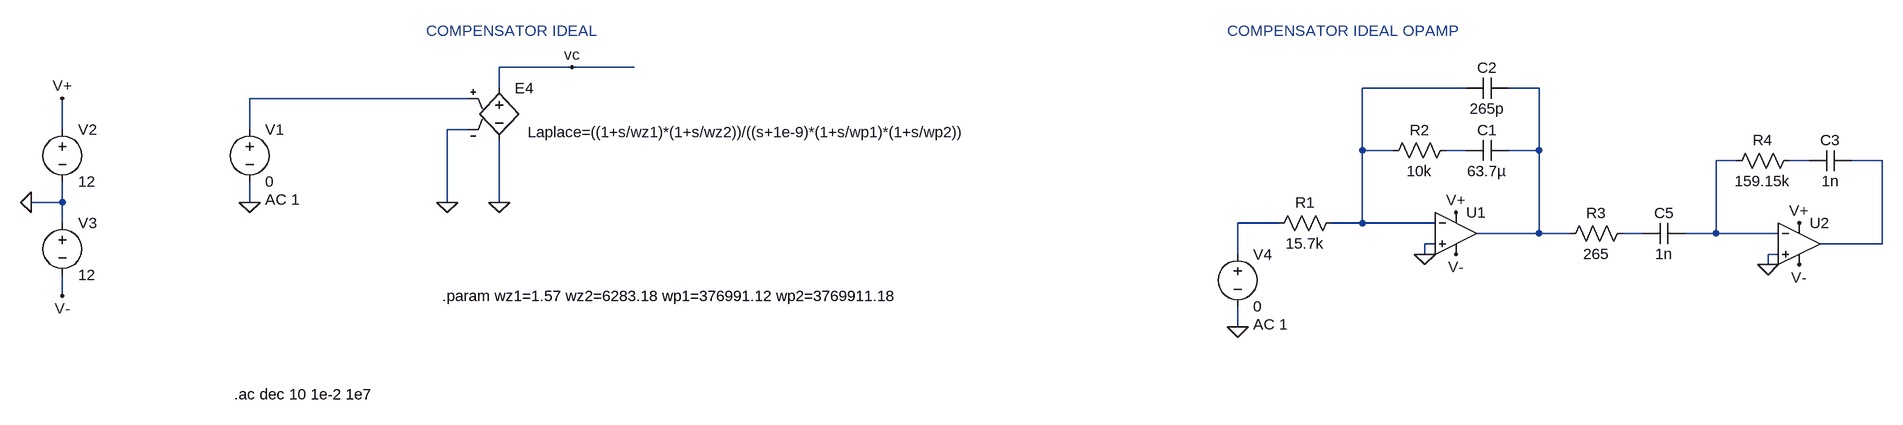
[diagram p0: schematic CompensatorFDT.asc]
CompensatorFDT.asc, the LTspice schematic file:
Version 4.1
SHEET 1 4068 680
WIRE 912 128 800 128
WIRE 1008 128 912 128
WIRE 800 160 800 128
WIRE 2288 160 2128 160
WIRE 2400 160 2352 160
WIRE 752 176 416 176
WIRE 128 224 128 176
WIRE 416 224 416 176
WIRE 752 224 720 224
WIRE 2128 256 2128 160
WIRE 2176 256 2128 256
WIRE 2288 256 2256 256
WIRE 2400 256 2400 160
WIRE 2400 256 2352 256
WIRE 2704 272 2672 272
WIRE 2816 272 2784 272
WIRE 2928 272 2880 272
WIRE 128 336 128 304
WIRE 128 336 80 336
WIRE 416 336 416 304
WIRE 720 336 720 224
WIRE 800 336 800 240
WIRE 128 368 128 336
WIRE 2000 368 1936 368
WIRE 2128 368 2128 256
WIRE 2128 368 2080 368
WIRE 2240 368 2128 368
WIRE 2400 384 2400 256
WIRE 2400 384 2304 384
WIRE 2448 384 2400 384
WIRE 2560 384 2528 384
WIRE 2672 384 2672 272
WIRE 2672 384 2624 384
WIRE 2768 384 2672 384
WIRE 2240 400 2224 400
WIRE 2928 400 2928 272
WIRE 2928 400 2832 400
WIRE 1936 416 1936 368
WIRE 2224 416 2224 400
WIRE 2768 416 2752 416
WIRE 2752 432 2752 416
WIRE 128 480 128 448
WIRE 1936 528 1936 496
FLAG 912 128 vc
FLAG 800 336 0
FLAG 720 336 0
FLAG 416 336 0
FLAG 80 336 0
FLAG 128 176 V+
FLAG 128 480 V-
FLAG 2224 416 0
FLAG 2752 432 0
FLAG 2272 352 V+
FLAG 2272 416 V-
FLAG 2800 368 V+
FLAG 2800 432 V-
FLAG 1936 528 0
SYMBOL e 800 144 R0
WINDOW 3 44 84 Left 2
SYMATTR Value Laplace=((1+s/wz1)*(1+s/wz2))/((s+1e-9)*(1+s/wp1)*(1+s/wp2))
SYMATTR InstName E4
SYMBOL voltage 416 208 R0
WINDOW 123 24 124 Left 2
WINDOW 39 0 0 Left 0
SYMATTR Value2 AC 1
SYMATTR InstName V1
SYMATTR Value 0
SYMBOL voltage 128 208 R0
SYMATTR InstName V2
SYMATTR Value 12
SYMBOL voltage 128 352 R0
SYMATTR InstName V3
SYMATTR Value 12
SYMBOL OpAmps\\UniversalOpAmp 2272 384 R0
SYMATTR InstName U1
SYMBOL res 2272 240 R90
WINDOW 0 0 56 VBottom 2
WINDOW 3 32 56 VTop 2
SYMATTR InstName R2
SYMATTR Value 10k
SYMBOL cap 2352 240 R90
WINDOW 0 0 32 VBottom 2
WINDOW 3 32 32 VTop 2
SYMATTR InstName C1
SYMATTR Value 63.7µ
SYMBOL cap 2352 144 R90
WINDOW 0 0 32 VBottom 2
WINDOW 3 32 32 VTop 2
SYMATTR InstName C2
SYMATTR Value 265p
SYMBOL OpAmps\\UniversalOpAmp 2800 400 R0
SYMATTR InstName U2
SYMBOL res 2544 368 R90
WINDOW 0 0 56 VBottom 2
WINDOW 3 32 56 VTop 2
SYMATTR InstName R3
SYMATTR Value 265
SYMBOL res 2800 256 R90
WINDOW 0 0 56 VBottom 2
WINDOW 3 32 56 VTop 2
SYMATTR InstName R4
SYMATTR Value 159.15k
SYMBOL cap 2880 256 R90
WINDOW 0 0 32 VBottom 2
WINDOW 3 32 32 VTop 2
SYMATTR InstName C3
SYMATTR Value 1n
SYMBOL cap 2624 368 R90
WINDOW 0 0 32 VBottom 2
WINDOW 3 32 32 VTop 2
SYMATTR InstName C5
SYMATTR Value 1n
SYMBOL res 2096 352 R90
WINDOW 0 0 56 VBottom 2
WINDOW 3 32 56 VTop 2
SYMATTR InstName R1
SYMATTR Value 15.7k
SYMBOL voltage 1936 400 R0
WINDOW 123 24 124 Left 2
WINDOW 39 0 0 Left 0
SYMATTR Value2 AC 1
SYMATTR InstName V4
SYMATTR Value 0
TEXT 712 480 Left 2 !.param wz1=1.57 wz2=6283.18 wp1=376991.12 wp2=3769911.18
TEXT 688 72 Left 2 ;COMPENSATOR IDEAL
TEXT 392 632 Left 2 !.ac dec 10 1e-2 1e7
TEXT 1920 72 Left 2 ;COMPENSATOR IDEAL OPAMP

The netlist it stands for:
* CompensatorFDT.asc
E4 vc 0 N003 0 Laplace=((1+s/wz1)*(1+s/wz2))/((s+1e-9)*(1+s/wp1)*(1+s/wp2))
V1 N003 0 0 AC 1
V2 V+ 0 12
V3 0 V- 12
X§U1 0 N001 V+ V- N002 level1 Avol=1Meg GBW=10Meg Vos=0 En=0 Enk=0 In=0 Ink=0 Rin=500Meg  ; pins In+ In- V+ V- OUT
R2 N004 N001 10k
C1 N002 N004 63.7µ
C2 N002 N001 265p
X§U2 0 N005 V+ V- N007 level1 Avol=1Meg GBW=10Meg Vos=0 En=0 Enk=0 In=0 Ink=0 Rin=500Meg  ; pins In+ In- V+ V- OUT
R3 N009 N002 265
R4 N006 N005 159.15k
C3 N007 N006 1n
C5 N005 N009 1n
R1 N001 N008 15.7k
V4 N008 0 0 AC 1
.param wz1=1.57 wz2=6283.18 wp1=376991.12 wp2=3769911.18
* COMPENSATOR IDEAL
.ac dec 10 1e-2 1e7
* COMPENSATOR IDEAL OPAMP
.lib UniversalOpAmp1.lib
.backanno
.end